# Altium schematic sheet NOR_flash.SchDoc
size A3; SheetNumber: 15; SheetTotal: 18
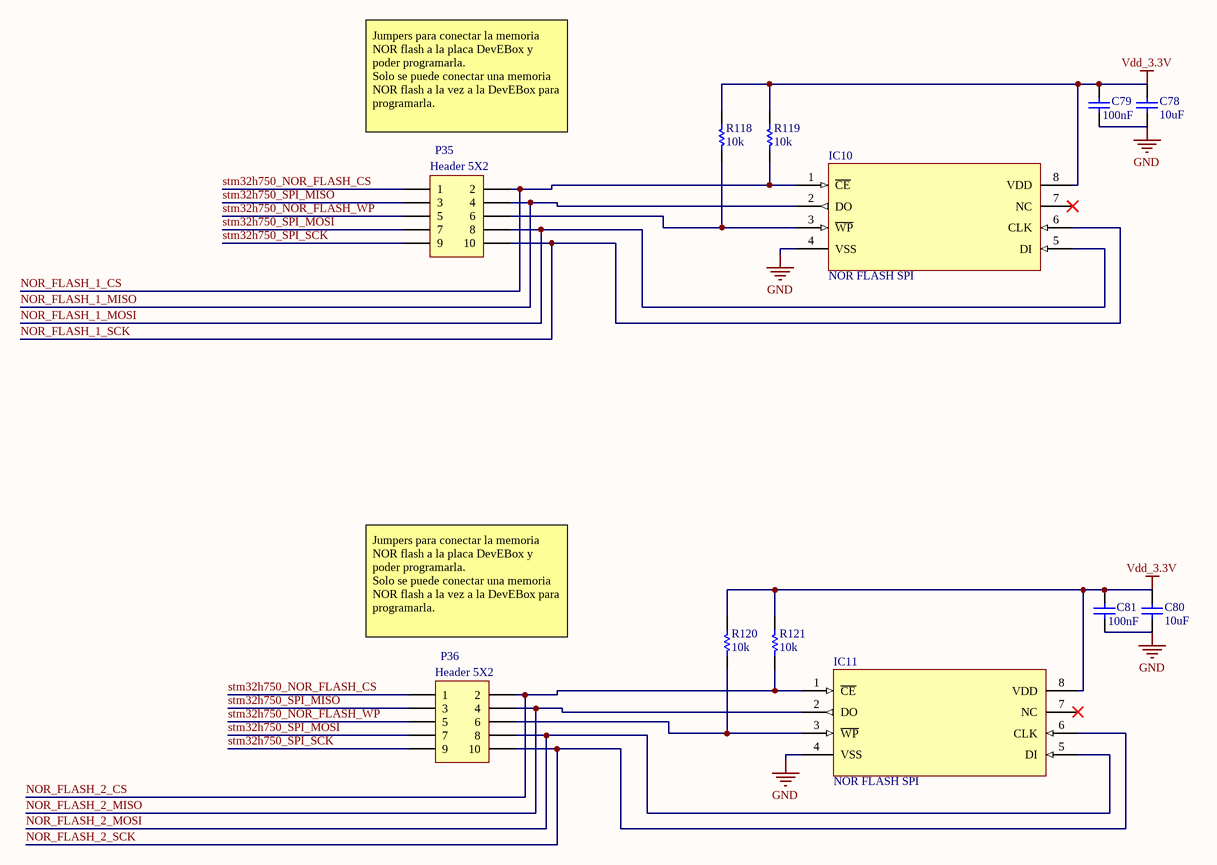
[diagram p0: NOR_flash.SchDoc]

## Parts
C78  value 10uF  [capacitor 0603]  (hidden comment: ceramic capacitor)
C79  value 100nF  [capacitor 0603]  (hidden comment: Ceramic capacitor)
C80  value 10uF  [capacitor 0603]  (hidden comment: ceramic capacitor)
C81  value 100nF  [capacitor 0603]  (hidden comment: Ceramic capacitor)
IC10  NOR FLASH SPI  [SOP8 / SOIC8 without dissipation]
IC11  NOR FLASH SPI  [SOP8 / SOIC8 without dissipation]
P35  Header 5X2  [HDR2X5]
P36  Header 5X2  [HDR2X5]
R118  value 10k  [resistor 0603]  (hidden comment: resistor)
R119  value 10k  [resistor 0603]  (hidden comment: resistor)
R120  value 10k  [resistor 0603]  (hidden comment: resistor)
R121  value 10k  [resistor 0603]  (hidden comment: resistor)

## Nets
GND: C78.1 C79.1 C80.1 C81.1 IC10.4(VSS) IC11.4(VSS)
Vdd_3.3V: C78.2 C79.2 C80.2 C81.2 IC10.8(VDD) IC11.8(VDD) R118.1 R119.1 R120.1 R121.1
NOR_FLASH_1_CS: IC10.1(~{CE}) P35.2 R119.2
NOR_FLASH_1_MISO: IC10.2(DO) P35.4
NOR_FLASH_1_MOSI: IC10.5(DI) P35.8
NOR_FLASH_1_SCK: IC10.6(CLK) P35.10
NOR_FLASH_2_CS: IC11.1(~{CE}) P36.2 R121.2
NOR_FLASH_2_MISO: IC11.2(DO) P36.4
NOR_FLASH_2_MOSI: IC11.5(DI) P36.8
NOR_FLASH_2_SCK: IC11.6(CLK) P36.10
stm32h750_NOR_FLASH_CS: P35.1 P36.1
stm32h750_NOR_FLASH_WP: P35.5 P36.5
stm32h750_SPI_MISO: P35.3 P36.3
stm32h750_SPI_MOSI: P35.7 P36.7
stm32h750_SPI_SCK: P35.9 P36.9
NetIC10_3: IC10.3(~{WP}) P35.6 R118.2
NetIC11_3: IC11.3(~{WP}) P36.6 R120.2

Not connected (* = marked no-connect by the designer): IC10 7(NC)*; IC11 7(NC)*

## Notes on the sheet
- Jumpers para conectar la memoria NOR flash a la placa DevEBox y poder programarla.
  Solo se puede conectar una memoria NOR flash a la vez a la DevEBox para programarla.

## Library data of the parts
C78 C80 = ceramic capacitor: Multilayer ceramic capacitor; V: 6.3; LCSC part: C1691; Package: 0603
C79 C81 = Ceramic capacitor: Multilayer ceramic capacitor; V: 50; LCSC part: C14663; Package: 0603
IC10 IC11 = NOR FLASH SPI: NOR flash memory / SPI
P35 P36 = Header 5X2: Header, 5-Pin, Dual row; LatestRevisionDate: 17-Jul-2002; LatestRevisionNote: Re-released for DXP Platform.; Publisher: Altium Limited
R118-R121 = resistor: Package: 0603